# EasyEDA Pro project eda_uahyxtbgs-165w-three-way-multi-protocol-fa-dc91a91e.epro, board 300W桌面电源显示板
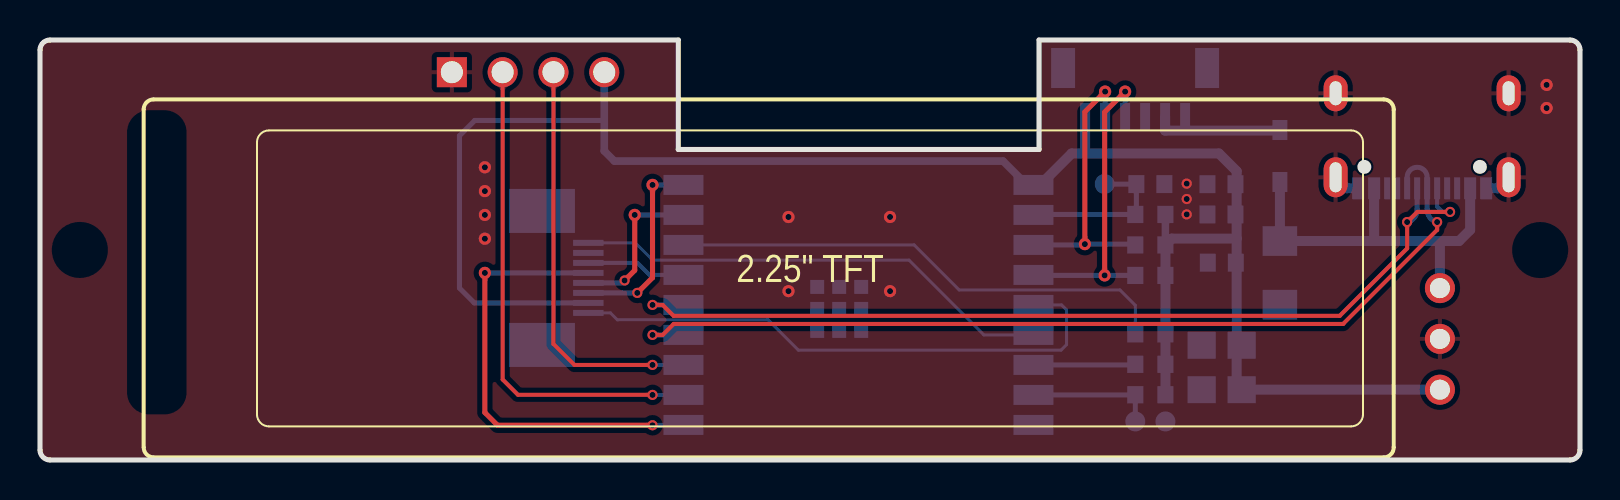
[diagram p6: board, top side]
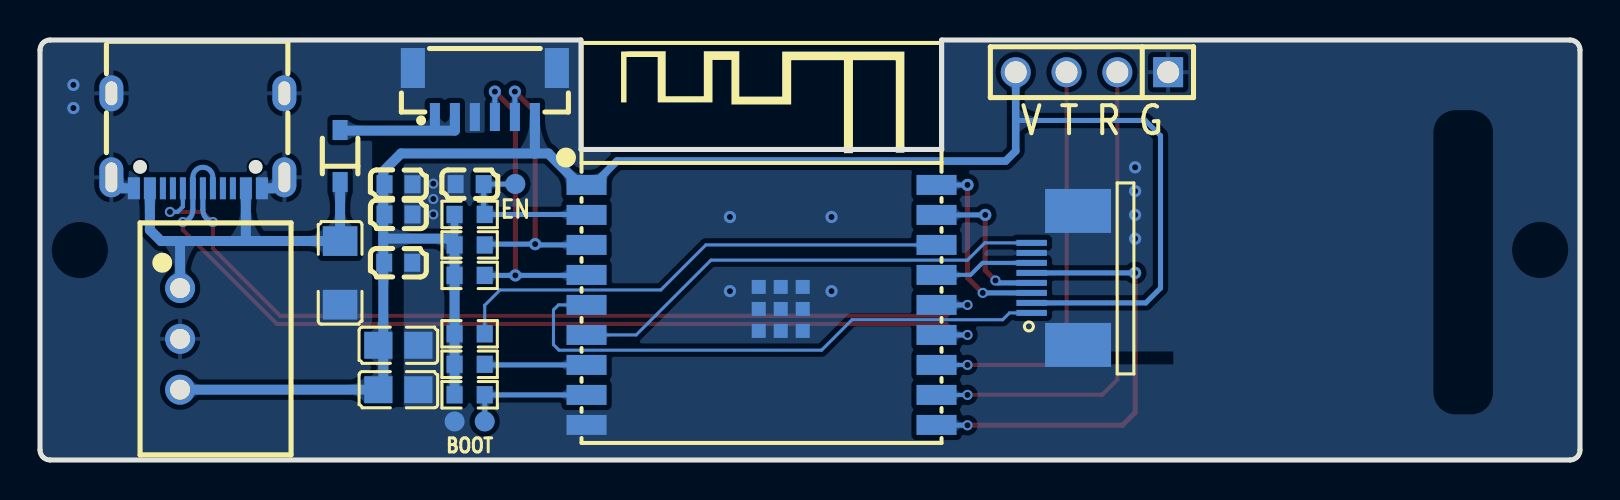
[diagram p7: board, bottom side, seen from below]

Outline 77 x 21 mm; copper layers: Top Layer, Bottom Layer. Coordinates in mm from the lower left corner of the outline.
Outline path: 0,20.5 arc(0.15,20.85) 0.5,21 31.91,21 31.91,15.53 49.95,15.53 49.95,21 76.5,21 arc(76.85,20.85) 77,20.5 77,0.5 arc(76.85,0.15) 76.5,0 0.5,0 arc(0.15,0.15) 0,0.5 0,20.5
Stack: Top Layer 0.035mm / Dielectric1 1.51mm FR4 er 4.5 / Bottom Layer 0.035mm

## Design rules (mm)
net USB_D+: DP1
net USB_D-: DP1
spacing copperThickness1oz (default): track to track 0.102, other pairs 0.152 to 0.3
spacing copperThickness2oz: track to track 0.102, other pairs 0.152 to 0.3
spacing Plane_innerPlane: track to track 0.102, other pairs 0.152 to 0.3
spacing Copper_copperRegion: track to track 0.102, other pairs 0.152 to 0.3
track width copperThickness1oz (default): min 0.127, default 0.254, max 6
track width copperThickness2oz: min 0.203, default 0.254, max 2.54
differential pair differentialPair (default): width min 0.127, default 0.254, max 2.54; gap min 0.152, default 0.152
pour e175 uses Copper_copperRegion
pour e204 uses Copper_copperRegion

## Placement (name value [footprint] x y rotation side)
C1  10uF  [C0603_5]  59.07 12.28 180 bottom
C2  100nF  [C0603_5]  59.07 13.79 180 bottom
C3  1uF  [C0603_5]  55.52 13.79 0 bottom
C5  10uF  [C1206_2]  62 9.36 90 bottom
C9  1uF  [C0603_5]  59.09 9.86 0 bottom
C10  22uF  [C0805]  59.08 5.74 0 bottom
C11  22uF  [C0805]  59.08 3.52 0 bottom
D4  1N5819WS  [SOD-323_L1.6-W1.3-LS2.6-RD-1]  62 15.2 90 bottom
FPC1  AFC07-S08ECA-00  [FPC-SMD_P0.5-8P_LCS-SH-H2.0]  26.18 9.1 270 bottom
H1  PZ254V-11-04P  [HDR-TH_4P-P2.54-V-M]  24.4 19.39 0 bottom
NOREF  -  [Pad_e31]  53.23 13.8 0 top
NOREF#2  -  [Pad_e32]  56.27 1.93 0 top
NOREF#3  -  [Pad_e33]  54.76 1.93 0 top
R3  10kΩ  [R0603_5]  55.52 12.28 0 bottom
R5  10kΩ  [R0603_5]  55.52 6.31 180 bottom
R6  10kΩ  [R0603_5]  55.52 4.78 180 bottom
R7  10kΩ  [R0603_5]  55.52 3.26 180 bottom
R8  5.1kΩ  [R0603_1]  55.52 10.75 180 bottom
R9  5.1kΩ  [R0603_1]  55.52 9.23 180 bottom
U2  ESP32-C3-WROOM-02-H4  [WIFIM-SMD_18P-L20.0-W18.0-P1.50]  40.92 7.75 180 bottom
U3  ZX-SH1.0-6PLT  [CONN-SMD_6P-P1.00_ZX-SH1.0-6PLT]  54.76 18.37 0 bottom
U5  K7803-1000R3  [PWRM-TH_YLPTEC_K78XX-1000R3]  70 6.06 270 bottom
USB1  TYPE-C 16PIN 2MD(073)  [USB-C-SMD_TYPE-C-6PIN-2MD-073]  69.11 15.96 0 bottom

## Footprints (pads in the part's own frame, mm; a bottom-side part is the same pattern mirrored in y, then rotated)
C0603_5
  rect 0.8x0.9 smd: 1(-0.7,0) 2(0.7,0)
C0805
  rect 1.41x1.35 smd: 1(-1,0) 2(1,0)
C1206_2
  rect 1.485x1.728 smd: 1(-1.593,0) 2(1.593,0)
CONN-SMD_6P-P1.00_ZX-SH1.0-6PLT
  rect 0.5x1.4 smd: 1(2.5,1.225) 2(1.5,1.225) 3(0.5,1.225) 4(-0.5,1.225) 5(-1.5,1.225) 6(-2.5,1.225)
  rect 1.2x2 smd: 7(-3.6,-1.225) 8(3.6,-1.225)
FPC-SMD_P0.5-8P_LCS-SH-H2.0
  rect 0.3x1.524 smd: 1(1.748,-1.236) 2(1.248,-1.236) 3(0.748,-1.236) 4(0.248,-1.236) 5(-0.252,-1.236) 6(-0.752,-1.236) 7(-1.252,-1.236) 8(-1.754,-1.235)
  rect 2.2x3.3 smd: 9(3.35,1.084) 10(-3.35,1.084)
HDR-TH_4P-P2.54-V-M
  rect 1.5x1.5 hole 1.1x0.85: 1(-3.81,0)
  round 1.5 hole 1.1x0.85: 2(-1.27,0) 3(1.27,0) 4(3.81,0)
Pad_e31
  round 1 smd far side: 2(0,0)
Pad_e32
  round 1 smd far side: 2(0,0)
Pad_e33
  round 1 smd far side: 1(0,0)
PWRM-TH_YLPTEC_K78XX-1000R3
  round 1.5 hole 1: 1(-2.54,0) 2(0,0) 3(2.54,0)
R0603_1
  rect 0.806x0.864 smd: 1(-0.753,0) 2(0.753,0)
R0603_5
  rect 0.806x0.864 smd: 1(-0.753,0) 2(0.753,0)
SOD-323_L1.6-W1.3-LS2.6-RD-1
  rect 1x0.75 smd: 1(-1.3,0) 2(1.3,0)
USB-C-SMD_TYPE-C-6PIN-2MD-073
  rect 0.6x1.1 smd: 1(-3.2,2.375) 2(-2.4,2.375) 11(2.4,2.375) 12(3.2,2.375)
  rect 0.3x1.1 smd: 3(-1.75,2.375) 4(-1.25,2.375) 5(-0.75,2.375) 6(-0.25,2.375) 7(0.25,2.375) 8(0.75,2.375) 9(1.25,2.375) 10(1.75,2.375)
  oval 1.2x1.8 hole 0.6x1.2: 13(-4.325,-2.375) 14(4.325,-2.375)
  oval 1.2x2 hole 0.6x1.5: 13(-4.325,1.825) 14(4.325,1.825)
WIFIM-SMD_18P-L20.0-W18.0-P1.50
  rect 2x1 smd: 1(-8.75,6) 2(-8.75,4.5) 3(-8.75,3) 4(-8.75,1.5) 5(-8.75,0) 6(-8.75,-1.5) 7(-8.75,-3) 8(-8.75,-4.5) 9(-8.75,-6) 10(8.75,-6) 11(8.75,-4.5) 12(8.75,-3) 13(8.75,-1.5) 14(8.75,0) 15(8.75,1.5) 16(8.75,3) 17(8.75,4.5) 18(8.75,6)
  rect 0.7x0.7 smd: 19(-0.14,0.9) 20(0.96,0.9) 21(2.06,0.9) 22(-0.14,-0.2) 23(0.96,-0.2) 24(2.06,-0.2) 25(-0.14,-1.3) 26(0.96,-1.3) 27(2.06,-1.3)

## Nets
As in the schematic, except:
GND: C1.2 C2.2 C3.2 C5.1 C9.1 C10.1 C11.1 FPC1.7 FPC1.9 FPC1.10 H1.1 NOREF#2.2 U2.9 U2.19 U2.20 U2.21 U2.22 U2.23 U2.24 U2.25 U2.26 U2.27 U3.3 U3.7 U3.8 U5.2 USB1.1 USB1.12 USB1.13 USB1.14
BOOT: NOREF#3.1 R7.2 U2.8
EN: C3.1 NOREF.2 R3.1 U2.2

Pads without a net: USB1 3 4 9 10

## Via types
v1: diameter 0.61, hole 0.305, Top Layer to Bottom Layer, 17 vias
v2: diameter 0.508, hole 0.305, Top Layer to Bottom Layer, 13 vias

## Routing (per net, layer and track width the routed paths; a pad name or vN(x,y) marks a point on that pad's centre or on a via; arc(x,y) is an arc through that point)
3V3: length 94.7
  Bottom Layer w0.254: 28.21,16.98 21.74,16.98 20.97,16.22 20.97,8.59 21.71,7.86 27.42,7.86
  Bottom Layer w0.381: U2.1 49.34,13.75 48.15,14.94 28.72,14.94 28.21,15.45 H1.4 ; R3.2 R8.1
  Bottom Layer w0.5: 59.84,11.07 59.84,14.44 58.95,15.33 52.26,15.33 ; 59.84,11.07 59.84,3.76 C11.2 U5.3 ; 59.84,11.07 56.59,11.07 R8.1 R9.1 R5.1 R6.1 R7.1 ; U3.6 52.26,15.33 ; 52.26,15.33 51.58,15.33 50.01,13.75 U2.1
GND: length 2.7
  Bottom Layer w0.5: USB1.14 72.88,13.59 USB1.12 ; USB1.1 65.33,13.59 USB1.13
  vias: v1(22.24,14.64) v1(22.24,13.44) v1(22.24,12.25) v1(22.24,11.06) v1(37.42,12.15) v1(37.42,8.44) v1(42.5,12.15) v1(42.5,8.44) v1(75.33,18.75) v1(75.33,17.6) v2(57.34,13.82) v2(57.34,13.05) v2(57.34,12.28)
VBUS: length 19.7
  Bottom Layer w0.5: D4.1 C5.2 70,10.95 ; 70,10.95 70.95,10.95 71.51,11.5 USB1.11 ; 70,10.95 U5.1 ; USB1.2 66.71,10.97
VIN: length 6.4
  Bottom Layer w0.5: U3.2 56.26,16.47 61.97,16.47
BOOT: length 6.3
  Bottom Layer w0.254: 49.82,3.25 54.76,3.25 ; R7.2 NOREF#3.1
EN: length 8.1
  Bottom Layer w0.203: 53.24,13.79 NOREF.2
  Bottom Layer w0.254: 54.78,12.29 54.82,12.33 C3.1 53.24,13.79 ; 49.82,12.25 49.85,12.28 R3.1
IO2: length 25.4
  Bottom Layer w0.152: 32.02,10.75 43.71,10.75 45.96,8.5 54,8.5 54.76,7.73 R5.2
IO8: length 5
  Bottom Layer w0.254: R6.2 54.73,4.75 49.82,4.75
LCD_BLK: length 24.3
  Bottom Layer w0.152: 49.82,6.25 47.19,6.25 43.45,9.99 30.62,9.99 29.76,10.86 FPC1.8
RX: length 24.6
  Top Layer w0.2: H1.2 23.13,4.02 23.9,3.26 30.62,3.26 v2(30.63,3.25)
  Bottom Layer w0.2: 32.02,3.25 v2(30.63,3.25)
SCL: length 15.8
  Top Layer w0.254: v1(54.26,18.42) 53.23,17.39 v1(53.23,9.23)
  Bottom Layer w0.254: R9.2 v1(53.23,9.23) 49.85,9.23 49.82,9.25 ; v1(54.26,18.42) U3.4
SDA: length 14.3
  Top Layer w0.254: v1(53.26,18.42) 52.24,17.41 v1(52.24,10.79)
  Bottom Layer w0.254: 49.82,10.75 52.2,10.75 v1(52.24,10.79) 54.72,10.79 R8.2 ; v1(53.26,18.42) U3.5
SPICLK: length 9.6
  Top Layer w0.254: v1(30.63,13.75) 30.63,9.12 v2(29.86,8.36)
  Bottom Layer w0.254: 27.42,8.36 v2(29.86,8.36) ; 32.02,13.75 v1(30.63,13.75)
SPICS: length 28.1
  Bottom Layer w0.152: 49.82,7.75 51.08,7.75 51.33,7.5 51.33,5.77 51.05,5.49 37.92,5.49 36.4,7.01 28.87,7.01 28.52,7.36 27.42,7.36
SPIDC: length 22.2
  Top Layer w0.254: v2(30.63,1.74) 22.88,1.74 22.24,2.37 v1(22.24,9.36)
  Bottom Layer w0.254: 32.02,1.75 32.01,1.74 v2(30.63,1.74) ; 27.42,9.36 v1(22.24,9.36)
SPIRS: length 4.9
  Bottom Layer w0.203: 32.02,9.25 30.47,9.25 29.87,9.86 27.42,9.86
SPISDA: length 7.6
  Top Layer w0.254: v2(29.23,8.98) 29.74,9.48 v1(29.74,12.25)
  Bottom Layer w0.254: 32.02,12.25 v1(29.74,12.25) ; 27.42,8.86 29.11,8.86 v2(29.23,8.98)
TX: length 20.4
  Top Layer w0.2: v2(30.63,4.75) 26.72,4.75 25.67,5.8 H1.3
  Bottom Layer w0.2: 32.02,4.75 v2(30.63,4.75)
USB_D+: length 48
  Top Layer w0.203: v2(30.63,7.75) 31.13,7.75 31.68,7.21 64.99,7.21 68.36,10.58 v2(68.36,11.9) 68.87,12.41 v2(70.5,12.41)
  Bottom Layer w0.203: v2(70.5,12.41) 70.12,12.41 69.86,12.67 USB1.8
  Bottom Layer w0.254: v2(30.63,7.75) 32.02,7.75 ; USB1.6 68.86,12.52 arc(68.72,12.12) v2(68.36,11.9)
USB_D-: length 46.7
  Top Layer w0.203: v2(30.63,6.25) 31.13,6.25 31.68,6.8 65.15,6.8 69.86,11.5 v2(69.86,11.9)
  Bottom Layer w0.254: 68.36,14.14 arc(68.86,14.64) 69.36,14.14 ; USB1.7 69.36,12.52 arc(69.49,12.12) v2(69.86,11.9) ; v2(30.63,6.25) 32.02,6.25

## Copper pours and planes (outline as drawn; the poured copper is in the pictures)
GND on Top Layer: -1.63,23.96 79.01,23.96 79.01,-2.45 -1.63,-2.45
GND on Bottom Layer: -1.63,23.96 79.01,23.96 79.01,-2.45 -1.63,-2.45

Small or netless copper shapes (teardrops, artwork), in the pictures only: 20 on Top Layer, 103 on Bottom Layer

## Text on the board
Bottom Silkscreen Layer: BOOT | EN | V T R G
Top Silkscreen Layer: 2.25" TFT
